# Altium project Pukk-Display-Module-v1.0.PrjPcb (part 1 of 4)
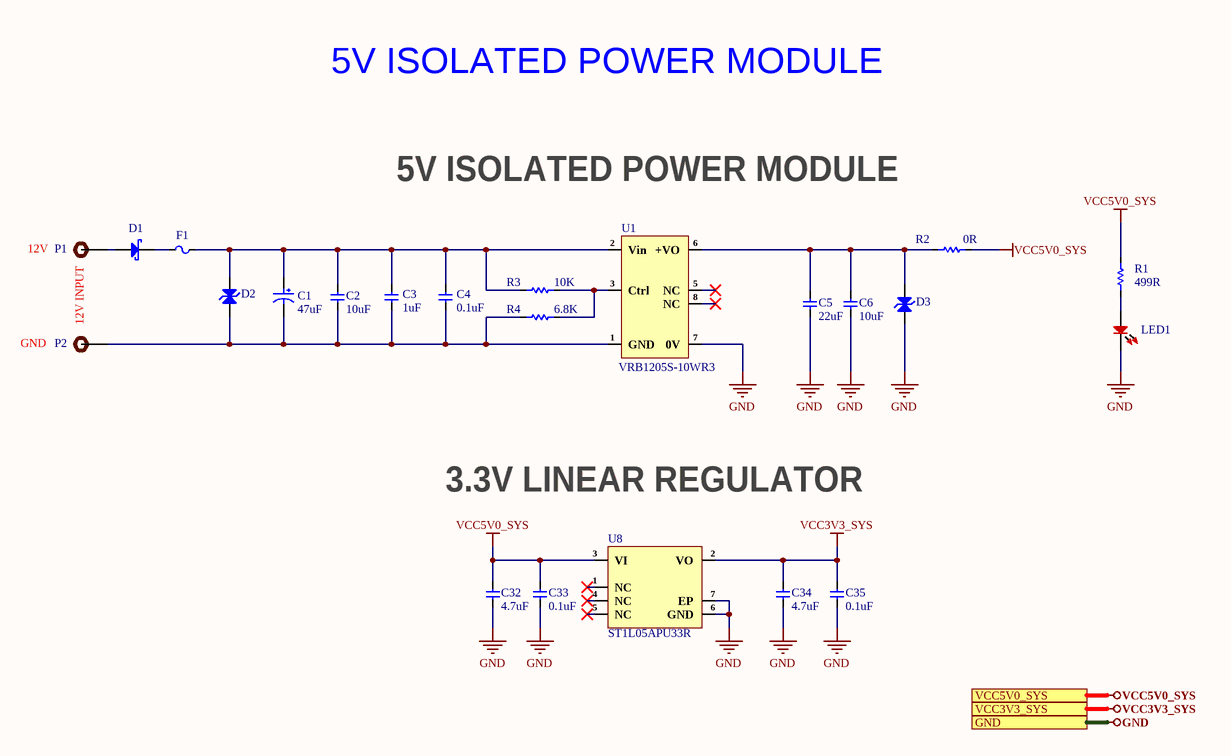
[diagram p0: POWER_SHEET.SchDoc]
10 sheets, 157 parts. Net scope: flat (ports and power ports of the same name join across sheets).
Board file: Pukk-Display-Module-v1.0.PcbDoc
Sheets:
  POWER_SHEET.SchDoc
  radxa_CM3J_SHEET-1.SchDoc
  radxa_CM3J_SHEET-2.SchDoc
  CAN_SHEET.SchDoc
  TYPE-C_INTERFACE_SHEET.SchDoc
  MIPI_DISPLAY-SHEET.SchDoc
  HDMI2.0_SHEET.SchDoc
  GPS_INTERFACE_SHEET.SchDoc
  JOYSTICK_BUTTON_SHEET.SchDoc
  MISCELLANEOUS_SHEET.SchDoc

## Sheet POWER_SHEET.SchDoc
size A4; SheetNumber: 1; SheetTotal: 10

### Parts
C1  47uF  [25SVPF47M]
C2  10uF  [Cap-0603]
C3  1uF  [Cap-0603]
C4  0.1uF  [Cap-0603]
C5  22uF  [Cap-0805]
C6  10uF  [Cap-0603]
C32  4.7uF  [Cap-0402]
C33  0.1uF  [Cap-0402]
C34  4.7uF  [Cap-0402]
C35  0.1uF  [Cap-0402]
D1  SS56  [SMA]  (value not drawn)
D2  SD12C.TCT  [SOD-323 (Bi-directional)]  (value not drawn)
D3  SMAJ5.0CA  [SMA Bi Directional]  (value not drawn)
F1  BSMD1812-150-33V  [Fuse-1812_]  (value not drawn)
LED1  RED  [LED-0603]  (value not drawn)
P1  0.5mm Test Pad  [0.5mm Test Pad]  (value not drawn)  (no BOM)
P2  0.5mm Test Pad  [0.5mm Test Pad]  (value not drawn)  (no BOM)
R1  499R  [Res-0402]
R2  0R  [Res-0805]
R3  10K  [Res-0402]
R4  6.8K  [Res-0402]
U1  VRB1205S-10WR3  [VRB1205S-10WR3]
U8  ST1L05APU33R  [DFN-6(3x3)]

### Ports
GND (see CAN_SHEET[3D], GPS_INTERFACE_SHEET[3D], HDMI2.0_SHEET[3D], JOYSTICK_BUTTON_SHEET[3D], MIPI_DISPLAY-SHEET[3D], MISCELLANEOUS_SHEET[3D], radxa_CM3J_SHEET-1[4C], radxa_CM3J_SHEET-2[3D], TYPE-C_INTERFACE_SHEET[3D]), VCC3V3_SYS (see GPS_INTERFACE_SHEET[3D], HDMI2.0_SHEET[3D], MIPI_DISPLAY-SHEET[3D], MISCELLANEOUS_SHEET[3D]), VCC5V0_SYS (see CAN_SHEET[3D], HDMI2.0_SHEET[3D], MIPI_DISPLAY-SHEET[3D], radxa_CM3J_SHEET-1[4C], TYPE-C_INTERFACE_SHEET[3D])

### Nets
GND: C5.1 C6.1 C32.1 C33.1 C34.1 C35.1 D3.1(A) LED1.2 U1.7(0V) U8.6(GND) U8.7(EP) ; port GND
VCC3V3_SYS: C34.2 C35.2 U8.2(VO) ; port VCC3V3_SYS
VCC5V0_SYS: C32.2 C33.2 R1.1 R2.2 U8.3(VI) ; port VCC5V0_SYS
NetC1_1: C1.1 C2.2 C3.2 C4.2 D2.2(A) F1.2 R3.2 U1.2(Vin)
NetC1_2: C1.2 C2.1 C3.1 C4.1 D2.1(A) P2.1 R4.1 U1.1(GND)
NetC5_2: C5.2 C6.2 D3.2(K) R2.1 U1.6(+VO)
NetD1_1: D1.1(K) F1.1
NetD1_2: D1.2(A) P1.1
NetLED1_1: LED1.1 R1.2
NetR3_1: R3.1 R4.2 U1.3(Ctrl)

Not connected (* = marked no-connect by the designer): U1 5(NC)* 8(NC)*; U8 1(NC)* 4(NC)* 5(NC)*

### Notes on the sheet
- 5V ISOLATED POWER MODULE
- (near P1) 12V
- (near P2) GND
- 12V INPUT
- 3.3V LINEAR REGULATOR
- File:
- Title:
- Date:
- Page
- Num:
- Total:
- Drawn By: Huzaifa Ali

### Library data of the parts
C1 = 25SVPF47M: CAP ALUM POLY 47UF 20% 25V SMD; Manufacturer: Panasonic; Dielectric Material: Aluminium; Polarity: Polarized; ESR (Equivalent Series Resistance): 30mR; Leakage Current: 235uA; Ripple Current: 140mA; Tan Delta: 0.12; Item Type: Capacitor; Supplier 1: Avnet; Manufacturer Part Number: 25SVPF47M; RoHS: Yes; Category: Polymer Capacitors; Stock 1: 1000; Pricing 1: 1000=0.43572, 2000=0.42658, 4000=0.41744, 6000=0.40830, 8000=0.39916 (USD); Mounting Technology: Surface Mount; Pins: 2; Package Shape: Cylindrical; Case/Package: 2626; Min Operating Temperature: -55°C; Max Operating Temperature: 105°C; Value: 47uF; Capacitor Type: Aluminium; Tolerance  (fill in as +-): 20%; Package Style: SMTMeter; Packaging: Tape and Reel; Tolerance (fill in as +-): 20%; Rated DC Voltage (URdc): 25V; Termination: Flat; Length: 7.3mm; Width: 6.6mm; Height: 5.9mm; Reach SVHC Compliant: Yes; RoHS Compliant: Yes; ComponentLink1URL: https://datasheet.ciiva.com:443/pdfs/VipMasterIC/IC/PANA/PANA-S-A0008969958/PANA-S-A0008969958-1.pdf?src-supplier=IHS+Markit; ComponentLink1Description: https://datasheet.ciiva.com:443/pdfs/VipMasterIC/IC/PANA/PANA-S-A0008969958/PANA-S-A0008969958-1.pdf?src-supplier=IHS+Markit; ComponentLink2URL: https://datasheet.ciiva.com/48542/svpf-eng-ds-48542390.pdf?src-supplier=Distrelec; ComponentLink2Description: https://datasheet.ciiva.com/48542/svpf-eng-ds-48542390.pdf?src-supplier=Distrelec; ComponentLink3URL: https://datasheet.ciiva.com/25746/1734360-25746558.pdf?src-supplier=Farnell; ComponentLink3Description: https://datasheet.ciiva.com/25746/1734360-25746558.pdf?src-supplier=Farnell; ComponentLink4URL: https://datasheet.ciiva.com/22746/1734360-22746218.pdf?src-supplier=Element14; ComponentLink4Description: https://datasheet.ciiva.com/22746/1734360-22746218.pdf?src-supplier=Element14; ComponentLink5URL: https://datasheet.ciiva.com/24025/svpf-os-262415-24025725.pdf?src-supplier=Mouser; ComponentLink5Description: https://datasheet.ciiva.com/24025/svpf-os-262415-24025725.pdf?src-supplier=Mouser; Supplier Part Number 1: 25SVPF47M; LCSC Part Number: C136280
C2 C6 = GRM188R61E106MA73D: CAP CER 10UF 25V X5R 0603; Manufacturer: Murata; Item Type: Capacitors; Material: 4241ConductorMaterial; Tolerance: 20%; Supplier: Mouser; LCSC Part Number: C91606; Manufacturer Part Number: GRM188R61E106MA73D; RoHS: Yes; Stock: 623875; Pricing: 1=0.18, 10=0.054, 50=0.054, 100=0.046, 1000=0.044, 10000=0.04 (USD); Mounting Technology: Surface Mount; Case/Package: 0603; Pins: 2; Case Code (Metric): 1608; Case Code (Imperial): 0603; Weight: 0.000222oz; Min Operating Temperature: -55°C; Max Operating Temperature: 85°C; Voltage Rating: 25V; Value: 10uF; Packaging: Cut Tape; Package Quantity: 1; Dielectric: X5R; Voltage: 25V; Termination: SMD/SMT; Voltage Rating (DC): 25V; Series: GRM; Construction: Flat; Length: 1.6mm; Width: 0.031inch; Height: 0.8mm; Thickness: 0.031inch; Depth: 0.8mm; Reach SVHC Compliant: No; RoHS Compliant: Yes; Lead Free: 5697LeadFree; ComponentLink1URL: https://datasheet.ciiva.com/22776/c02e-22776427.pdf?src-supplier=Farnell; ComponentLink1Description: https://datasheet.ciiva.com/22776/c02e-22776427.pdf?src-supplier=Farnell; ComponentLink2URL: https://datasheet.ciiva.com/22619/c02e-22619674.pdf?src-supplier=Element14; ComponentLink2Description: https://datasheet.ciiva.com/22619/c02e-22619674.pdf?src-supplier=Element14; ComponentLink3URL: https://datasheet.ciiva.com/22776/608985-22776426.pdf?src-supplier=Farnell; ComponentLink3Description: https://datasheet.ciiva.com/22776/608985-22776426.pdf?src-supplier=Farnell; ComponentLink4URL: https://datasheet.ciiva.com/14906/partnumbering-e-01-14906431.pdf?src-supplier=Digikey; ComponentLink4Description: https://datasheet.ciiva.com/14906/partnumbering-e-01-14906431.pdf?src-supplier=Digikey; ComponentLink5URL: https://datasheet.ciiva.com/14906/partnumbering-e-01-14906429.pdf?src-supplier=Digikey; ComponentLink5Description: https://datasheet.ciiva.com/14906/partnumbering-e-01-14906429.pdf?src-supplier=Digikey
C3 = C1608X7R1E105K080AB: CAP CER 1UF 25V X7R 0603; Manufacturer: TDK; Tolerance: 10%; Item Type: Capacitors; Material: 4241ConductorMaterial; Manufacturer Part Number: C1608X7R1E105K080AB; RoHS: Yes; Case/Package: 0603; Case Code (Metric): 1608; Case Code (Imperial): 0603; Min Operating Temperature: -55°C; Max Operating Temperature: 125°C; Packaging: Tape and Reel; Voltage Rating: 25V; Dielectric: X7R; Package Quantity: 1; Length: 1.6mm; Width: 0.031inch; Thickness: 0.037inch; Lead Free: Lead Free; RoHS Compliant: Yes; ComponentLink1URL: https://datasheet.ciiva.com/23802/1796654-23802776.pdf?src-supplier=Newark; ComponentLink1Description: https://datasheet.ciiva.com/23802/1796654-23802776.pdf?src-supplier=Newark; ComponentLink2URL: https://datasheet.ciiva.com/22725/1913358-22725530.pdf?src-supplier=Element14; ComponentLink2Description: https://datasheet.ciiva.com/22725/1913358-22725530.pdf?src-supplier=Element14; ComponentLink3URL: https://datasheet.ciiva.com/28693/mlcc-commercial-general-en-28693447.pdf?src-supplier=Element14; ComponentLink3Description: https://datasheet.ciiva.com/28693/mlcc-commercial-general-en-28693447.pdf?src-supplier=Element14; Supplier: Digikey; Stock: 239206; Pricing: 1=0.18, 10=0.103, 50=0.0722, 100=0.0627, 500=0.04664, 1000=0.04163 (USD); Mounting Technology: Surface Mount; Dielectric Material: 4241ConductorMaterial; Value: 1uF; Voltage: 25V; Series: C; Construction: Flat; Height: 0.8mm; Depth: 0.8mm; Radiation Hardening: No; Reach SVHC Compliant: No; ComponentLink4URL: https://datasheet.ciiva.com/6290/tdkmlcccaprange-6290854.pdf?src-supplier=Digikey; ComponentLink4Description: https://datasheet.ciiva.com/6290/tdkmlcccaprange-6290854.pdf?src-supplier=Digikey; ComponentLink5URL: https://datasheet.ciiva.com/26834/getdatasheetpartid-727834-26834380.pdf?src-supplier=Verical; ComponentLink5Description: https://datasheet.ciiva.com/26834/getdatasheetpartid-727834-26834380.pdf?src-supplier=Verical
C4 = CC0603JRX7R8BB104: CAP CER 0.1UF 25V X7R 0603; Manufacturer: Yageo; Tolerance: 5%; Item Type: Capacitors; Value: 100nF; Manufacturer Part Number: CC0603JRX7R8BB104; RoHS: Yes; Case/Package: 0603; Case Code (Imperial): 0603; Case Code (Metric): 1608; Min Operating Temperature: -55°C; Max Operating Temperature: 125°C; Dielectric: X7R; Voltage Rating: 25V; Voltage Rating (DC): 25V; Packaging: Tape and Reel; Termination: SMD/SMT; Length: 1.6mm; Width: 0.031inch; Height: 0.8mm; Thickness: 0.035inch; Lead Free: Lead Free; Halogen Free: Halogen Free; ComponentLink1URL: https://datasheet.ciiva.com/11465/upy-gphc-x7r-6-3v-to-50v-8-11465031.pdf?src-supplier=Avnet; ComponentLink1Description: https://datasheet.ciiva.com/11465/upy-gphc-x7r-6-3v-to-50v-8-11465031.pdf?src-supplier=Avnet; LCSC Part Number: C327087; Supplier: Digikey; Stock: 448767; Pricing: 1=0.1, 10=0.057, 50=0.039, 100=0.0335, 500=0.02436, 1000=0.0215 (USD); Mounting Technology: Surface Mount; Weight: 7.1E-05oz; Series: CC; Construction: Flat; RoHS Compliant: Yes
C5 = GRM21BZ71A226ME15L: CAP CER 22UF 10V X7R 0805; Manufacturer: Murata; Material: 4241ConductorMaterial; Tolerance: 20%; Item Type: Capacitor; Supplier: Digi-Key; Supplier Part Number: 490-GRM21BZ71A226ME15LCT-ND; Manufacturer Part Number: GRM21BZ71A226ME15L; RoHS: Yes; Category: Ceramic Capacitors; Stock: 49126; Pricing: 1=0.39, 10=0.259, 50=0.191, 100=0.1556, 500=0.12282, 1000=0.10372 (USD); Package: 0805; Min Operating Temperature: -55°C; Max Operating Temperature: 125°C; Value: 22uF; Voltage Rating: 10V; Length: 2mm; Width: 1.25mm; Height: 1.45mm; Thickness: 1.25mm; ComponentLink1URL: https://datasheet.octopart.com/GRM21BZ71A226ME15L-Murata-datasheet-165579666.pdf?src-supplier=TME; ComponentLink1Description: https://datasheet.octopart.com/GRM21BZ71A226ME15L-Murata-datasheet-165579666.pdf?src-supplier=TME; LCSC Part Number: C907991; ComponentLink2Description: LCSC; ComponentLink2URL: https://www.lcsc.com/product-detail/Multilayer-Ceramic-Capacitors-MLCC-SMD-SMT_Murata-Electronics-GRM21BZ71A226ME15L_C907991.html
C32 C34 = CL05A475MO5NUNC: CAP CER 4.7UF 16V X5R 0402; Manufacturer: Samsung; Tolerance: 20%; Material: 4241ConductorMaterial; Manufacturer Part Number: CL05A475MO5NUNC; RoHS: Yes; Case/Package: 0402; Case Code (Metric): 1005; Case Code (Imperial): 0402; Min Operating Temperature: -55°C; Max Operating Temperature: 85°C; Voltage Rating: 16V; Packaging: Cut Tape; Voltage Rating (DC): 16V; Series: CL; Length: 0.039inch; Width: 0.02inch; Height: 550um; RoHS Compliant: Yes; ComponentLink1URL: http://www.farnell.com/datasheets/2710653.pdf?src-supplier=Farnell; ComponentLink1Description: http://www.farnell.com/datasheets/2710653.pdf?src-supplier=Farnell; ComponentLink2URL: http://www.samsungsem.com/kr/support/product-search/mlcc/CL05A475MO5NUNC.jsp?src-supplier=Digikey; ComponentLink2Description: http://www.samsungsem.com/kr/support/product-search/mlcc/CL05A475MO5NUNC.jsp?src-supplier=Digikey; ComponentLink3URL: http://www.farnell.com/datasheets/2710653.pdf?src-supplier=Element14; ComponentLink3Description: http://www.farnell.com/datasheets/2710653.pdf?src-supplier=Element14; ComponentLink4URL: https://datasheet.octopart.com/CL05A475MO5NUNC-Samsung-Electro-Mechanics-datasheet-123102911.pdf?src-supplier=Future+Electronics; ComponentLink4Description: https://datasheet.octopart.com/CL05A475MO5NUNC-Samsung-Electro-Mechanics-datasheet-123102911.pdf?src-supplier=Future+Electronics; ComponentLink5URL: http://www.farnell.com/datasheets/2710653.pdf?src-supplier=Newark; ComponentLink5Description: http://www.farnell.com/datasheets/2710653.pdf?src-supplier=Newark; Supplier 1: Avnet; Category: Ceramic Capacitors; Stock 1: 50000; Pricing 1: 10000=0.09712 (USD); Mount: Surface Mount; Capacitance: 4.7uF; Thickness: 0.022inch; Supplier Part Number 1: CL05A475MO5NUNC
C33 C35 = GRM155R71H104ME14D: CAP CER 0.1UF 50V X7R 0402; Manufacturer: Murata; Tolerance: 20%; Capacitance: 100nF; Item Type: Capacitor; Supplier 1: Avnet; Manufacturer Part Number: GRM155R71H104ME14D; RoHS: Yes; Category: Ceramic Capacitors; Stock 1: 100000; Pricing 1: 10000=0.00444, 20000=0.00420, 40000=0.00396, 60000=0.00372, 80000=0.00348, 100000=0.00324, 1000000=0.00300 (USD); Mount: Surface Mount; Case/Package: 0402; Min Operating Temperature: -55°C; Max Operating Temperature: 125°C; Packaging: Cut Tape; Voltage Rating: 50V; Length: 0.039inch; Width: 0.02inch; Thickness: 0.022inch; RoHS Compliant: Yes; ComponentLink1URL: http://www.mouser.com/ds/2/281/c02e-2905.pdf?src-supplier=Mouser; ComponentLink1Description: http://www.mouser.com/ds/2/281/c02e-2905.pdf?src-supplier=Mouser; ComponentLink2URL: http://search.murata.co.jp/Ceramy/image/img/A01X/G101/ENG/GRM155R71H104ME14-01.pdf?src-supplier=Digi-Key; ComponentLink2Description: http://search.murata.co.jp/Ceramy/image/img/A01X/G101/ENG/GRM155R71H104ME14-01.pdf?src-supplier=Digi-Key; ComponentLink3URL: http://psearch.en.murata.com/capacitor/product/GRM155R71H104ME14%23.pdf?src-supplier=Avnet; ComponentLink3Description: http://psearch.en.murata.com/capacitor/product/GRM155R71H104ME14%23.pdf?src-supplier=Avnet; Supplier Part Number 1: GRM155R71H104ME14D; LCSC Part Number: C182412
D1 = SS56: DIODE SCHOTTKY 60V 5A SMA; Manufacturer: MDD; LCSC Par Number: C65009; Manufacturer Part Number: SS56; Iterm Type: Diode; ComponentLink1Description: LCSC; ComponentLink1URL: https://www.lcsc.com/product-detail/Schottky-Barrier-Diodes-SBD_MDD-Microdiode-Electronics-SS56_C65009.html
D2 = SD12C.TCT: 24V 350W 13.3V 12V SOD-323 ESD and Surge Protection (TVS/ESD) ROHS; Manufacturer: SEMTECH; Item Type: Diode; Manufacturer Part Number: SD12C.TCT; Package: SOD-323; LCSC Part Number: C85198; ComponentLink1Description: LCSC; ComponentLink1URL: https://www.lcsc.com/product-detail/ESD-and-Surge-Protection-TVS-ESD_SEMTECH-SD12C-TCT_C85198.html?s_z=n_SD12
D3 = SMAJ5.0CA: TVS DIODE 5VWM 9.2VC SMA; Manufacturer: FTR; Manufacturer Part Number: SMAJ5.0CA; Package: SMA(DO-214AC); Item Type: Diode; LCSC Part Number: C693487; ComponentLink1Description: LCSC; ComponentLink1URL: https://www.lcsc.com/product-detail/TVS_GOODWORK-SMAJ5-0CA_C908809.html
F1 = BSMD1812-150-33V: 33V 1.5A 40A 3A 1812 Resettable Fuses ROHS; Manufacturer: BHFUSE; Item Type: Fuse; Manufacturer Part Number: BSMD1812-150-33V; Package: 1812; LCSC Part Number: C883154; ComponentLink1Description: LCSC; ComponentLink1URL: https://www.lcsc.com/product-detail/Resettable-Fuses_BHFUSE-BSMD1812-150-33V_C883154.html
LED1 = NCD0603R3: RED LED 0603 Light Emitting Diodes; Manufacturer: Foshan NationStar Optoelectronics; Manufacturer Part Number: NCD0603R3; Package: 0603; Item Type: LED; LCSC Part Number: C3151730; ComponentLink1Description: LCSC; ComponentLink1URL: https://www.lcsc.com/product-detail/Light-Emitting-Diodes-LED_Foshan-NationStar-Optoelectronics-NCD0603R3_C3151730.html
P1 P2 = 0.5mm Test Pad: Test pad
R1 = RC0402FR-07499RL: RES 499 OHM 1% 1/16W 0402; Manufacturer: Yageo; Power Rating: 62.5mW; Voltage Rating: 50V; Max Power Dissipation: 63mW; Temperature Coefficient: 100ppm/°C; Supplier 1: Mouser; Manufacturer Part Number: RC0402FR-07499RL; RoHS: Yes; Category: Chip SMD Resistors; Stock 1: 936879; Pricing 1: 1=0.10000, 10=0.01200, 50=0.01200, 100=0.00500, 1000=0.00300, 10000=0.00100 (USD); Case/Package: 0402; Case Code (Metric): 1005; Case Code (Imperial): 0402; Size Code: 0402; Min Operating Temperature: -55°C; Max Operating Temperature: 155°C; Resistance: 499R; Tolerance: 1%; Package Quantity: 1; Packaging: Tape and Reel; Resistor Type: Thick Film; Number of Terminations: 2; Termination: SMD/SMT; Voltage Rating (DC): 50V; Features: Moisture Resistant; Series: RC; Resistance Tolerance: 1%; Construction: Rectangular; Length: 1mm; Width: 0.02inch; Height: 0.016inch; Depth: 0.5mm; RoHS Compliant: Yes; REACH SVHC: No SVHC; Military Standard: Not; Lead Free: Lead Free; ComponentLink1URL: https://datasheet.ciiva.com/2453/pyu-r-int-thick-7-2453539.pdf?src-supplier=Digi-Key; ComponentLink1Description: https://datasheet.ciiva.com/2453/pyu-r-int-thick-7-2453539.pdf?src-supplier=Digi-Key; ComponentLink2URL: https://datasheet.ciiva.com/2453/pyu-r-int-thick-7-2453540.pdf?src-supplier=Digi-Key; ComponentLink2Description: https://datasheet.ciiva.com/2453/pyu-r-int-thick-7-2453540.pdf?src-supplier=Digi-Key; ComponentLink3URL: https://datasheet.ciiva.com/2453/pyu-r-int-thick-7-2453538.pdf?src-supplier=Digi-Key; ComponentLink3Description: https://datasheet.ciiva.com/2453/pyu-r-int-thick-7-2453538.pdf?src-supplier=Digi-Key; Supplier Part Number 1: 603-RC0402FR-07499RL; LCSC Part Number: C137970
R2 = RC0805FR-070RL: RES 0 OHM JUMPER 1/8W 0805; Manufacturer: Yageo; Resistance: 0mR; Tolerance: 1%; Power Rating: 125mW; Item Type: Resistor; Supplier 1: Avnet; Manufacturer Part Number: RC0805FR-070RL; RoHS: Yes; Category: Chip SMD Resistors; Stock 1: 85000; Pricing 1: 5000=0.00281, 10000=0.00277, 20000=0.00269 (USD); Case/Package: 0805; Contact Plating: Tin,Matte; Case Code (Imperial): 0805; Case Code (Metric): 2012; Size Code: 0805; Min Operating Temperature: -55°C; Max Operating Temperature: 155°C; Resistor Type: Thick Film; Packaging: Tape and Reel; Features: Moisture Resistant; Series: RC; Max Power Dissipation: 125mW; Number of Terminations: 2; Construction: Rectangular; Length: 2mm; Depth: 1.25mm; Radiation Hardening: No; Military Standard: Not; Lead Free: Lead Free; RoHS Compliant: Yes; ComponentLink1URL: https://datasheet.ciiva.com/15189/getdatasheetpartid-348154-15189885.pdf?src-supplier=Verical; ComponentLink1Description: https://datasheet.ciiva.com/15189/getdatasheetpartid-348154-15189885.pdf?src-supplier=Verical; ComponentLink2URL: https://datasheet.ciiva.com/17042/rc0805-17042698.pdf?src-supplier=Future+Electronics; ComponentLink2Description: https://datasheet.ciiva.com/17042/rc0805-17042698.pdf?src-supplier=Future+Electronics; Supplier Part Number 1: RC0805FR-070RL; LCSC Part Number: C100045
R3 = RC0402FR-0710KL: RES 10K OHM 1% 1/16W 0402; Manufacturer: Yageo; Resistance: 10kR; Voltage Rating (DC): 50V; Temperature Coefficient: 100ppm/°C; Power Rating: 62.5mW; Max Power Dissipation: 63mW; Item Type: Resistor; Supplier 1: Mouser; Manufacturer Part Number: RC0402FR-0710KL; RoHS: Yes; Category: Chip SMD Resistors; Stock 1: 18648329; Pricing 1: 1=0.10000, 10=0.01400, 50=0.01400, 100=0.00500, 1000=0.00300, 10000=0.00200 (USD); Case/Package: 0402; Number of Pins: 2; Case Code (Imperial): 0402; Case Code (Metric): 1005; Min Operating Temperature: -55°C; Max Operating Temperature: 155°C; Resistor Type: Thick Film; Tolerance: 1%; Packaging: Tape and Reel; Voltage Rating: 50V; Termination: SMD/SMT; Working Voltage: 50V; Number of Terminations: 2; Features: Moisture Resistant; Series: RC; Resistance Tolerance: 1%; Construction: Rectangular; Length: 1mm; Width: 0.5mm; Height: 0.32mm; Depth: 0.5mm; Lead Pitch: 0.2mm; REACH SVHC: No SVHC; Lead Free: Lead Free; RoHS Compliant: Yes; Military Standard: Not; ComponentLink1URL: https://datasheet.ciiva.com/7660/38568-7660787.pdf?src-supplier=Element14; ComponentLink1Description: https://datasheet.ciiva.com/7660/38568-7660787.pdf?src-supplier=Element14; ComponentLink2URL: https://datasheet.ciiva.com/7849/1686128-7849814.pdf?src-supplier=Element14; ComponentLink2Description: https://datasheet.ciiva.com/7849/1686128-7849814.pdf?src-supplier=Element14; ComponentLink3URL: https://datasheet.ciiva.com/7983/1018594-7983486.pdf?src-supplier=Element14; ComponentLink3Description: https://datasheet.ciiva.com/7983/1018594-7983486.pdf?src-supplier=Element14; ComponentLink4URL: https://datasheet.ciiva.com/22747/1018594-22747512.pdf?src-supplier=Element14; ComponentLink4Description: https://datasheet.ciiva.com/22747/1018594-22747512.pdf?src-supplier=Element14; ComponentLink5URL: https://datasheet.ciiva.com/12667/pyu-rc0402-51-rohs-l-6-r-12667067.pdf?src-supplier=Mouser; ComponentLink5Description: https://datasheet.ciiva.com/12667/pyu-rc0402-51-rohs-l-6-r-12667067.pdf?src-supplier=Mouser; ComponentLink6URL: https://datasheet.ciiva.com/7849/1784430-7849813.pdf?src-supplier=Element14; ComponentLink6Description: https://datasheet.ciiva.com/7849/1784430-7849813.pdf?src-supplier=Element14; ComponentLink7URL: https://datasheet.ciiva.com/7849/1784430-7849815.pdf?src-supplier=Element14; ComponentLink7Description: https://datasheet.ciiva.com/7849/1784430-7849815.pdf?src-supplier=Element14; Supplier Part Number 1: 603-RC0402FR-0710KL; LCSC Part Number: C60490
R4 = RT0402BRC076K8L: RES SMD 6.8K OHM 0.1% 1/16W 0402; Manufacturer: Yageo; Item Type: Resistors; Value: 6.8kR; Max Power Dissipation: 63mW; Temperature Coefficient: 15ppm/°C; Supplier: Digikey; LCSC Part Number: C852943; Manufacturer Part Number: RT0402BRC076K8L; RoHS: Yes; Stock: 20494; Pricing: 1=0.51, 10=0.36, 50=0.279, 100=0.2487, 500=0.18748, 1000=0.16452, 5000=0.14066 (USD); Case/Package: 0402; Min Operating Temperature: -55°C; Max Operating Temperature: 155°C; Packaging: Tape and Reel; Number of Terminations: 2; Tolerance: 0.1%; Features: Moisture Resistant; Series: RT; Length: 0.039inch; Width: 0.02inch; Height: 0.014inch; RoHS Compliant: Yes
U1 = VRB1205S-10WR3: SIP Isolated Power Modules ROHS; Manufacturer: YLPTEC; Manufacturer Part Number: VRB1205S-10WR3; Package: SIP; LCSC Part Number: C5369851; Item Type: Power Module; ComponentLink1Description: LCSC; ComponentLink1URL: https://jlcpcb.com/partdetail/Ylptec-VRB1205S10WR3/C5369851
U8 = ST1L05APU33R: IC REG LINEAR 3.3V 1.3A 6DFN; Manufacturer: STMicroelectronics; Supplier: Digikey; LCSC Part Number: C283488; Manufacturer Part Number: ST1L05APU33R; RoHS: Yes; Item Type: IC; Stock: 7599; Pricing: 1=1.06, 10=0.766, 25=0.692, 100=0.6103, 250=0.57136, 500=0.5479, 1000=0.5286 (USD); ComponentLink1URL: https://datasheet.ciiva.com/2053/cd00186925-2053848.pdf?src-supplier=Digikey; ComponentLink1Description: https://datasheet.ciiva.com/2053/cd00186925-2053848.pdf?src-supplier=Digikey; ComponentLink2URL: https://datasheet.ciiva.com/2053/cd00186925-2053849.pdf?src-supplier=Digikey; ComponentLink2Description: https://datasheet.ciiva.com/2053/cd00186925-2053849.pdf?src-supplier=Digikey; ComponentLink3URL: https://datasheet.ciiva.com/2053/cd00186925-2053850.pdf?src-supplier=Digikey; ComponentLink3Description: https://datasheet.ciiva.com/2053/cd00186925-2053850.pdf?src-supplier=Digikey; ComponentLink4URL: https://datasheet.ciiva.com/16489/cd00186925-16489850.pdf?src-supplier=Future+Electronics; ComponentLink4Description: https://datasheet.ciiva.com/16489/cd00186925-16489850.pdf?src-supplier=Future+Electronics

## Sheet radxa_CM3J_SHEET-1.SchDoc
size A4; SheetNumber: 2; SheetTotal: 10
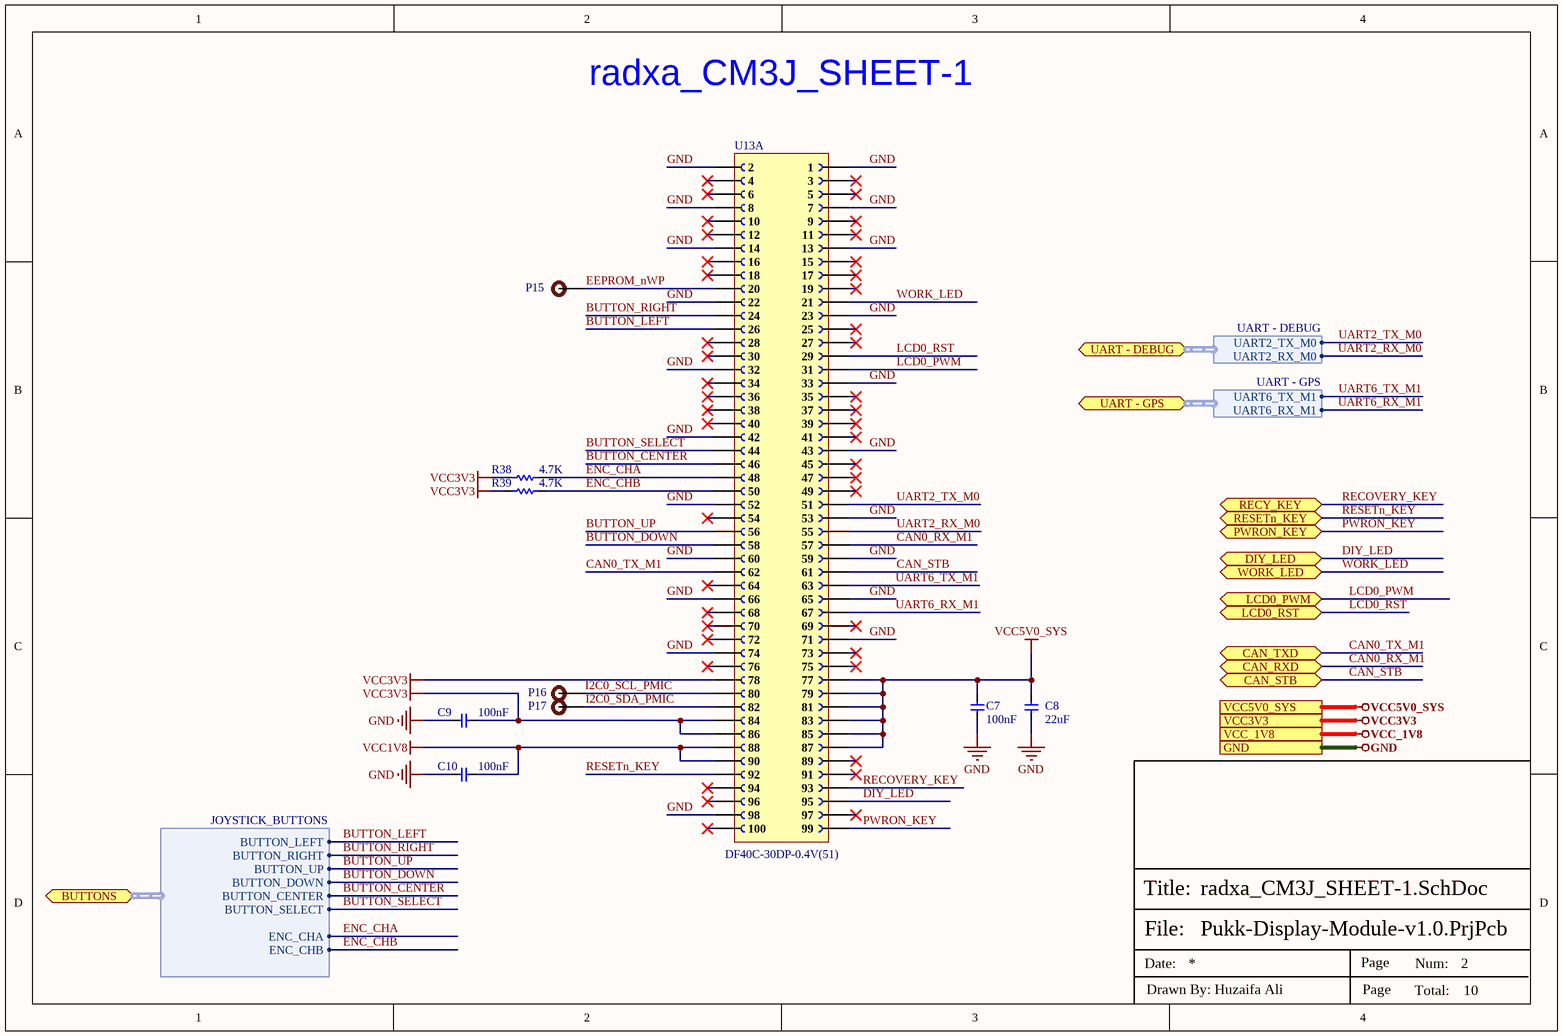
[diagram p1: radxa_CM3J_SHEET-1.SchDoc]

### Parts
C7  100nF  [Cap-0402]
C8  22uF  [Cap-0402]
C9  100nF  [Cap-0402]
C10  100nF  [Cap-0402]
P15  TEST POINT 0.5mm Dia  [Test-point - 0.5mm]  (value not drawn)  (no BOM)
P16  TEST POINT 0.5mm Dia  [Test-point - 0.5mm]  (value not drawn)  (no BOM)
P17  TEST POINT 0.5mm Dia  [Test-point - 0.5mm]  (value not drawn)  (no BOM)
R38  4.7K  [Res-0402]
R39  4.7K  [Res-0402]
U13A  DF40C-30DP-0.4V(51)  [DF40C-100DS-0.4V(51)]

### Ports
BUTTONS (bidir, harness JOYSTICK_BUTTONS, see JOYSTICK_BUTTON_SHEET[2D]), CAN_RXD (bidir, see CAN_SHEET[2D]), CAN_STB (bidir, see CAN_SHEET[2D]), CAN_TXD (bidir, see CAN_SHEET[2D]), DIY_LED (bidir, see MISCELLANEOUS_SHEET[3D]), GND (see CAN_SHEET[3D], GPS_INTERFACE_SHEET[3D], HDMI2.0_SHEET[3D], JOYSTICK_BUTTON_SHEET[3C], MIPI_DISPLAY-SHEET[3D], MISCELLANEOUS_SHEET[3D], POWER_SHEET[3C], radxa_CM3J_SHEET-2[3D], TYPE-C_INTERFACE_SHEET[3D]), LCD0_PWM (bidir, see MIPI_DISPLAY-SHEET[3D]), LCD0_RST (bidir, see MIPI_DISPLAY-SHEET[3D]), PWRON_KEY (bidir, see MISCELLANEOUS_SHEET[3D]), RECY_KEY (bidir, see MISCELLANEOUS_SHEET[3D]), RESETn_KEY (bidir, see MISCELLANEOUS_SHEET[3D]), UART - DEBUG (bidir, harness UART - DEBUG, see MISCELLANEOUS_SHEET[3C]), UART - GPS (bidir, harness UART - GPS, see GPS_INTERFACE_SHEET[1D]), VCC3V3 (see CAN_SHEET[3D], JOYSTICK_BUTTON_SHEET[3C]), VCC5V0_SYS (see CAN_SHEET[3D], HDMI2.0_SHEET[3D], MIPI_DISPLAY-SHEET[3D], POWER_SHEET[3C], TYPE-C_INTERFACE_SHEET[3D]), VCC_1V8, WORK_LED (bidir, see MISCELLANEOUS_SHEET[3D])

### Harnesses
UART - GPS: UART6_TX_M1, UART6_RX_M1
UART - DEBUG: UART2_TX_M0, UART2_RX_M0
JOYSTICK_BUTTONS: BUTTON_LEFT, BUTTON_RIGHT, BUTTON_UP, BUTTON_DOWN, BUTTON_CENTER, BUTTON_SELECT, ENC_CHA, ENC_CHB

### Nets
GND: C7.1 C8.1 C9.1 C10.1 U13A.1 U13A.2 U13A.7 U13A.8 U13A.13 U13A.14 U13A.22 U13A.23 U13A.32 U13A.33 U13A.42 U13A.43 U13A.52 U13A.53 U13A.59 U13A.60 U13A.65 U13A.66 U13A.71 U13A.74 U13A.98 ; port GND
VCC1V8: C10.2 U13A.88 U13A.90
VCC3V3: C9.2 R38.2 R39.2 U13A.78 U13A.84 U13A.86 ; port VCC3V3
VCC5V0_SYS: C7.2 C8.2 U13A.77 U13A.79 U13A.81 U13A.83 U13A.85 U13A.87 ; port VCC5V0_SYS
VCC_1V8: port VCC_1V8
BUTTON_CENTER: U13A.46 ; port BUTTONS.BUTTON_CENTER
BUTTON_DOWN: U13A.58 ; port BUTTONS.BUTTON_DOWN
BUTTON_LEFT: U13A.26 ; port BUTTONS.BUTTON_LEFT
BUTTON_RIGHT: U13A.24 ; port BUTTONS.BUTTON_RIGHT
BUTTON_SELECT: U13A.44 ; port BUTTONS.BUTTON_SELECT
BUTTON_UP: U13A.56 ; port BUTTONS.BUTTON_UP
CAN0_RX_M1: U13A.57 ; port CAN_RXD
CAN0_TX_M1: U13A.62 ; port CAN_TXD
CAN_STB: U13A.61 ; port CAN_STB
DIY_LED: U13A.95 ; port DIY_LED
EEPROM_nWP: P15.1 U13A.20
ENC_CHA: R38.1 U13A.48 ; port BUTTONS.ENC_CHA
ENC_CHB: R39.1 U13A.50 ; port BUTTONS.ENC_CHB
I2C0_SCL_PMIC: P16.1 U13A.80
I2C0_SDA_PMIC: P17.1 U13A.82
LCD0_PWM: U13A.31 ; port LCD0_PWM
LCD0_RST: U13A.29 ; port LCD0_RST
PWRON_KEY: U13A.99 ; port PWRON_KEY
RECOVERY_KEY: U13A.93 ; port RECY_KEY
RESETn_KEY: U13A.92 ; port RESETn_KEY
UART2_RX_M0: U13A.55 ; port UART - DEBUG.UART2_RX_M0
UART2_TX_M0: U13A.51 ; port UART - DEBUG.UART2_TX_M0
UART6_RX_M1: U13A.67 ; port UART - GPS.UART6_RX_M1
UART6_TX_M1: U13A.63 ; port UART - GPS.UART6_TX_M1
WORK_LED: U13A.21 ; port WORK_LED

Not connected (* = marked no-connect by the designer): U13A 3* 4* 5* 6* 9* 10* 11* 12* 15* 16* 17* 18* 19* 25* 27* 28* 30* 34* 35* 36* 37* 38* 39* 40* 41* 45* 47* 49* 54* 64* 68* 69* 70* 72* 73* 75* 76* 89* 91* 94* 96* 97* 100*

### Notes on the sheet
- radxa_CM3J_SHEET-1
- File:
- Title:
- Date:
- Page
- Num:
- Total:
- Drawn By: Huzaifa Ali

### Library data of the parts
C7 C9 C10 = CC0402KRX5R7BB104: CAP CER 0.1UF 16V X5R 0402; Manufacturer: Yageo; Tolerance: 10%; Supplier 1: Mouser; Manufacturer Part Number: CC0402KRX5R7BB104; RoHS: Yes; Category: Ceramic Capacitors; Stock 1: 936792; Pricing 1: 1=0.10000, 10=0.02300, 50=0.02300, 100=0.01100, 1000=0.00600, 10000=0.00400 (USD); Mount: Surface Mount; Case/Package: 0402; Number of Pins: 2; Case Code (Metric): 1005; Case Code (Imperial): 0402; Min Operating Temperature: -55°C; Max Operating Temperature: 85°C; Capacitance: 100nF; Dielectric: X5R; Packaging: Tape and Reel; Voltage Rating: 16V; Package Quantity: 1; Voltage Rating (DC): 16V; Termination: SMD/SMT; Resistor Type: Ceramic; Series: CC; Construction: Flat; Length: 1mm; Width: 0.02inch; Height: 0.5mm; Thickness: 0.022inch; Depth: 0.5mm; Radiation Hardening: No; REACH SVHC: Unknown; Lead Free: Lead Free; Halogen Free: Halogen Free; RoHS Compliant: Yes; ComponentLink1URL: https://datasheet.ciiva.com/155/mlccorderingcode-155879.pdf?src-supplier=Digi-Key; ComponentLink1Description: https://datasheet.ciiva.com/155/mlccorderingcode-155879.pdf?src-supplier=Digi-Key; ComponentLink2URL: https://datasheet.ciiva.com/155/mlccorderingcode-155878.pdf?src-supplier=Digi-Key; ComponentLink2Description: https://datasheet.ciiva.com/155/mlccorderingcode-155878.pdf?src-supplier=Digi-Key; ComponentLink3URL: https://datasheet.ciiva.com/155/mlccorderingcode-155880.pdf?src-supplier=Digi-Key; ComponentLink3Description: https://datasheet.ciiva.com/155/mlccorderingcode-155880.pdf?src-supplier=Digi-Key; ComponentLink4URL: https://datasheet.ciiva.com/11464/upy-gphc-x5r-4v-to-50v-12-11464869.pdf?src-supplier=Avnet; ComponentLink4Description: https://datasheet.ciiva.com/11464/upy-gphc-x5r-4v-to-50v-12-11464869.pdf?src-supplier=Avnet; Supplier Part Number 1: 603-CC402KRX5R7BB104; LCSC Part Number: C106204
C8 = GRM158R61A226ME15D: CAP CER 22UF 10V X5R 0402; Manufacturer: Murata; Item Type: Capacitor; Material: 4241ConductorMaterial; Dielectric: 1537DielectricType; Tolerance: 20%; Manufacturer Part Number: GRM158R61A226ME15D; LCSC Part Number: C3845593; Supplier: Mouser; Supplier Part Number: 81-GRM158R61A226ME5D; RoHS: Yes; Stock: 328944; Pricing: 1=0.46, 10=0.225, 50=0.225, 100=0.146, 1000=0.124, 10000=0.106 (USD); Case/Package: 343Case; Min Operating Temperature: -55°C; Max Operating Temperature: 85°C; Value: 22uF; Voltage Rating: 10V; Voltage Rating (DC): 10V; Length: 1mm; Width: 500um; Height: 800um; Thickness: 800um; Category: Ceramic Capacitors
P15-P17 = TEST POINT 0.5mm Dia: Test Point ON; Item Type: Test Point; Manufacturer Part Number: TEST POINT 0.5mm Dia
R38 R39 = RC0402FR-074K7L: RES 4.7K OHM 1% 1/16W 0402; Manufacturer: Yageo; Voltage Rating (DC): 50V; Power Rating: 62.5mW; Resistance: 4.7kR; Temperature Coefficient: 100ppm/°C; Max Power Dissipation: 63mW; Item Type: Resistor; Supplier 1: Avnet; Manufacturer Part Number: RC0402FR-074K7L; RoHS: Yes; Category: Chip SMD Resistors; Stock 1: 2420000; Pricing 1: 10000=0.00085 (USD); Case/Package: 0402; Number of Pins: 2; Case Code (Imperial): 0402; Case Code (Metric): 1005; Size Code: 0402; Min Operating Temperature: -55°C; Max Operating Temperature: 155°C; Tolerance: 1%; Voltage Rating: 50V; Packaging: Tape and Reel; Resistor Type: Thick Film; Termination: SMD/SMT; Features: Moisture Resistant; Series: RC; Number of Terminations: 2; Resistance Tolerance: 1%; Construction: Rectangular; Length: 1mm; Width: 0.5mm; Height: 0.32mm; Depth: 0.5mm; Height - Seated (Max): 0.016inch; RoHS Compliant: Yes; Reach SVHC Compliant: Yes; Military Standard: Not; Lead Free: Lead Free; ComponentLink1URL: https://datasheet.ciiva.com/22661/1686128-22661342.pdf?src-supplier=Element14; ComponentLink1Description: https://datasheet.ciiva.com/22661/1686128-22661342.pdf?src-supplier=Element14; ComponentLink2URL: https://datasheet.ciiva.com/7850/1018594-7850022.pdf?src-supplier=Element14; ComponentLink2Description: https://datasheet.ciiva.com/7850/1018594-7850022.pdf?src-supplier=Element14; ComponentLink3URL: https://datasheet.ciiva.com/7850/1018594-7850023.pdf?src-supplier=Element14; ComponentLink3Description: https://datasheet.ciiva.com/7850/1018594-7850023.pdf?src-supplier=Element14; ComponentLink4URL: https://datasheet.ciiva.com/15215/getdatasheetpartid-328119-15215035.pdf?src-supplier=Verical; ComponentLink4Description: https://datasheet.ciiva.com/15215/getdatasheetpartid-328119-15215035.pdf?src-supplier=Verical; Supplier Part Number 1: RC0402FR-074K7L; LCSC Part Number: C105871
U13A = DF40C-30DP-0.4V(51): CONN RCPT 100POS SMD GOLD; Manufacturer: Hirose; Item Type: Headers and Wire Housings; Current Rating: 300mA; Voltage Rating: 30V; Connector Type: Plug; Number of Positions: 30; Contact Resistance: 90mR; Pitch: 0.4mm; Mated Stacking Heights: 4mm; Contact Pitch: 400um; Supplier: Future Electronics; LCSC Part Number: C597931; Manufacturer Part Number: DF40C-30DP-0.4V(51); RoHS: Yes; Stock: 10000; Pricing: 5000=0.405 (USD); Mounting Technology: Surface Mount; Contact Plating: Gold; Contact Material: Bronze,Copper Alloy; Housing Material: Polymer; Housing Color: Black; Package Quantity: 5000; Number of Rows: 2; Packaging: Tape and Reel; Termination: SMD/SMT; Number of Contacts: 30; Orientation: Straight; Series: DF40; Contact Voltage Rating (AC): 30V; Contact Voltage Rating (DC): 30V; Reach SVHC Compliant: No; Lead Free: Lead Free; RoHS Compliant: Yes; ComponentLink1URL: https://datasheet.ciiva.com/11746/0900766b80e0bfd2-11746269.pdf?src-supplier=Rs; ComponentLink1Description: https://datasheet.ciiva.com/11746/0900766b80e0bfd2-11746269.pdf?src-supplier=Rs; ComponentLink2URL: https://datasheet.ciiva.com/46408/1824826-46408902.pdf?src-supplier=Element14; ComponentLink2Description: https://datasheet.ciiva.com/46408/1824826-46408902.pdf?src-supplier=Element14

## Sheet radxa_CM3J_SHEET-2.SchDoc
size A4; SheetNumber: 3; SheetTotal: 10
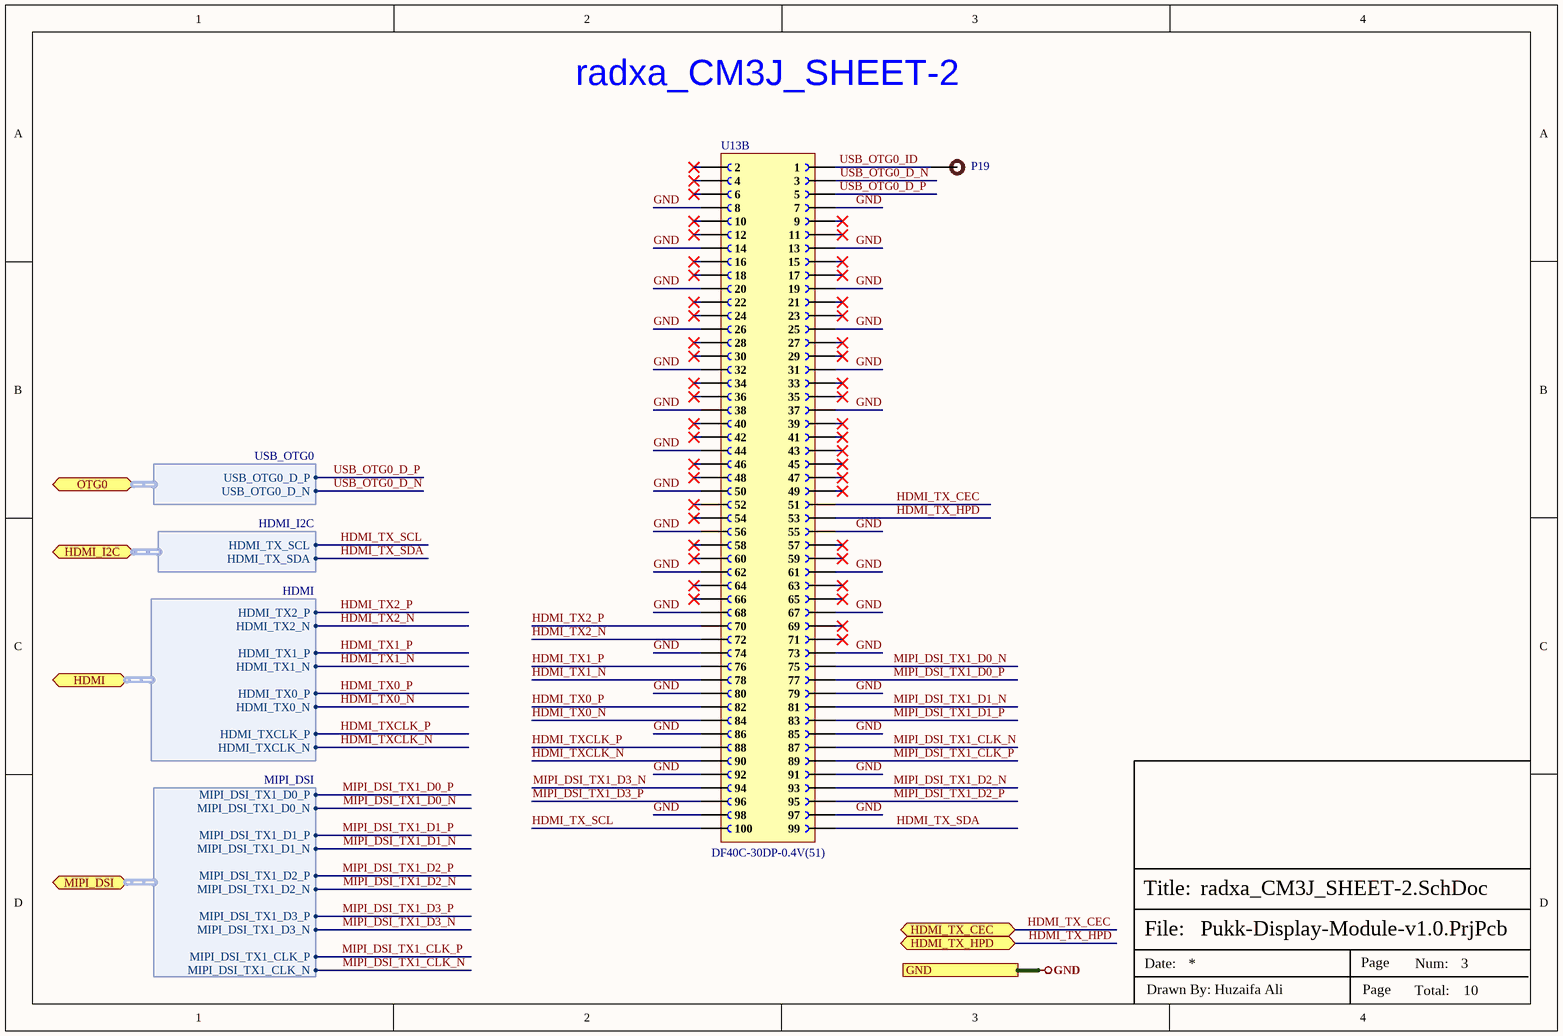
[diagram p2: radxa_CM3J_SHEET-2.SchDoc]

### Parts
P19  TEST POINT 0.5mm Dia  [Test-point - 0.5mm]  (value not drawn)  (no BOM)
U13B  DF40C-30DP-0.4V(51)  [DF40C-100DS-0.4V(51)]

### Ports
GND (see CAN_SHEET[3D], GPS_INTERFACE_SHEET[3D], HDMI2.0_SHEET[3D], JOYSTICK_BUTTON_SHEET[3D], MIPI_DISPLAY-SHEET[3D], MISCELLANEOUS_SHEET[3D], POWER_SHEET[3C], radxa_CM3J_SHEET-1[4C], TYPE-C_INTERFACE_SHEET[3D]), HDMI (bidir, harness HDMI, see HDMI2.0_SHEET[2D]), HDMI_I2C (bidir, harness HDMI_I2C, see HDMI2.0_SHEET[2D]), HDMI_TX_CEC (bidir, see HDMI2.0_SHEET[3D]), HDMI_TX_HPD (bidir, see HDMI2.0_SHEET[3D]), MIPI_DSI (bidir, harness MIPI_DSI, see MIPI_DISPLAY-SHEET[1D]), OTG0 (bidir, harness USB_OTG0, see TYPE-C_INTERFACE_SHEET[2D])

### Harnesses
MIPI_DSI: MIPI_DSI_TX1_D0_P, MIPI_DSI_TX1_D0_N, MIPI_DSI_TX1_D1_P, MIPI_DSI_TX1_D1_N, MIPI_DSI_TX1_D2_P, MIPI_DSI_TX1_D2_N, MIPI_DSI_TX1_D3_P, MIPI_DSI_TX1_D3_N, MIPI_DSI_TX1_CLK_P, MIPI_DSI_TX1_CLK_N
HDMI_I2C: HDMI_TX_SCL, HDMI_TX_SDA
HDMI: HDMI_TX2_P, HDMI_TX2_N, HDMI_TX1_P, HDMI_TX1_N, HDMI_TX0_P, HDMI_TX0_N, HDMI_TXCLK_P, HDMI_TXCLK_N
USB_OTG0: USB_OTG0_D_P, USB_OTG0_D_N

### Nets
GND: U13B.7 U13B.8 U13B.13 U13B.14 U13B.19 U13B.20 U13B.25 U13B.26 U13B.31 U13B.32 U13B.37 U13B.38 U13B.44 U13B.50 U13B.55 U13B.56 U13B.61 U13B.62 U13B.67 U13B.68 U13B.73 U13B.74 U13B.79 U13B.80 U13B.85 U13B.86 U13B.91 U13B.92 U13B.97 U13B.98 ; port GND
HDMI_TX0_N: U13B.84 ; port HDMI.HDMI_TX0_N
HDMI_TX0_P: U13B.82 ; port HDMI.HDMI_TX0_P
HDMI_TX1_N: U13B.78 ; port HDMI.HDMI_TX1_N
HDMI_TX1_P: U13B.76 ; port HDMI.HDMI_TX1_P
HDMI_TX2_N: U13B.72 ; port HDMI.HDMI_TX2_N
HDMI_TX2_P: U13B.70 ; port HDMI.HDMI_TX2_P
HDMI_TX_CEC: U13B.51 ; port HDMI_TX_CEC
HDMI_TX_HPD: U13B.53 ; port HDMI_TX_HPD
HDMI_TX_SCL: U13B.100 ; port HDMI_I2C.HDMI_TX_SCL
HDMI_TX_SDA: U13B.99 ; port HDMI_I2C.HDMI_TX_SDA
HDMI_TXCLK_N: U13B.90 ; port HDMI.HDMI_TXCLK_N
HDMI_TXCLK_P: U13B.88 ; port HDMI.HDMI_TXCLK_P
MIPI_DSI_TX1_CLK_N: U13B.87 ; port MIPI_DSI.MIPI_DSI_TX1_CLK_N
MIPI_DSI_TX1_CLK_P: U13B.89 ; port MIPI_DSI.MIPI_DSI_TX1_CLK_P
MIPI_DSI_TX1_D0_N: U13B.75 ; port MIPI_DSI.MIPI_DSI_TX1_D0_N
MIPI_DSI_TX1_D0_P: U13B.77 ; port MIPI_DSI.MIPI_DSI_TX1_D0_P
MIPI_DSI_TX1_D1_N: U13B.81 ; port MIPI_DSI.MIPI_DSI_TX1_D1_N
MIPI_DSI_TX1_D1_P: U13B.83 ; port MIPI_DSI.MIPI_DSI_TX1_D1_P
MIPI_DSI_TX1_D2_N: U13B.93 ; port MIPI_DSI.MIPI_DSI_TX1_D2_N
MIPI_DSI_TX1_D2_P: U13B.95 ; port MIPI_DSI.MIPI_DSI_TX1_D2_P
MIPI_DSI_TX1_D3_N: U13B.94 ; port MIPI_DSI.MIPI_DSI_TX1_D3_N
MIPI_DSI_TX1_D3_P: U13B.96 ; port MIPI_DSI.MIPI_DSI_TX1_D3_P
USB_OTG0_D_N: U13B.3 ; port OTG0.USB_OTG0_D_N
USB_OTG0_D_P: U13B.5 ; port OTG0.USB_OTG0_D_P
USB_OTG0_ID: P19.1 U13B.1

Not connected (* = marked no-connect by the designer): U13B 2* 4* 6* 9* 10* 11* 12* 15* 16* 17* 18* 21* 22* 23* 24* 27* 28* 29* 30* 33* 34* 35* 36* 39* 40* 41* 42* 43* 45* 46* 47* 48* 49* 52* 54* 57* 58* 59* 60* 63* 64* 65* 66* 69* 71*

### Notes on the sheet
- radxa_CM3J_SHEET-2
- File:
- Title:
- Date:
- Page
- Num:
- Total:
- Drawn By: Huzaifa Ali

### Library data of the parts
P19 = TEST POINT 0.5mm Dia: Test Point ON; Item Type: Test Point; Manufacturer Part Number: TEST POINT 0.5mm Dia
U13B = DF40C-30DP-0.4V(51): as U13A on sheet radxa_CM3J_SHEET-1; Supplier: Future Electronics; LCSC Part Number: C597931; Manufacturer Part Number: DF40C-30DP-0.4V(51); RoHS: Yes; Stock: 10000; Pricing: 5000=0.405 (USD); Mounting Technology: Surface Mount; Contact Plating: Gold; Contact Material: Bronze,Copper Alloy; Housing Material: Polymer; Housing Color: Black; Package Quantity: 5000; Number of Rows: 2; Packaging: Tape and Reel; Termination: SMD/SMT; Number of Contacts: 30; Orientation: Straight; Series: DF40; Contact Voltage Rating (AC): 30V; Contact Voltage Rating (DC): 30V; Reach SVHC Compliant: No; Lead Free: Lead Free; RoHS Compliant: Yes; ComponentLink1URL: https://datasheet.ciiva.com/11746/0900766b80e0bfd2-11746269.pdf?src-supplier=Rs; ComponentLink1Description: https://datasheet.ciiva.com/11746/0900766b80e0bfd2-11746269.pdf?src-supplier=Rs; ComponentLink2URL: https://datasheet.ciiva.com/46408/1824826-46408902.pdf?src-supplier=Element14; ComponentLink2Description: https://datasheet.ciiva.com/46408/1824826-46408902.pdf?src-supplier=Element14

## Sheet CAN_SHEET.SchDoc
size A4; SheetNumber: 4; SheetTotal: 10
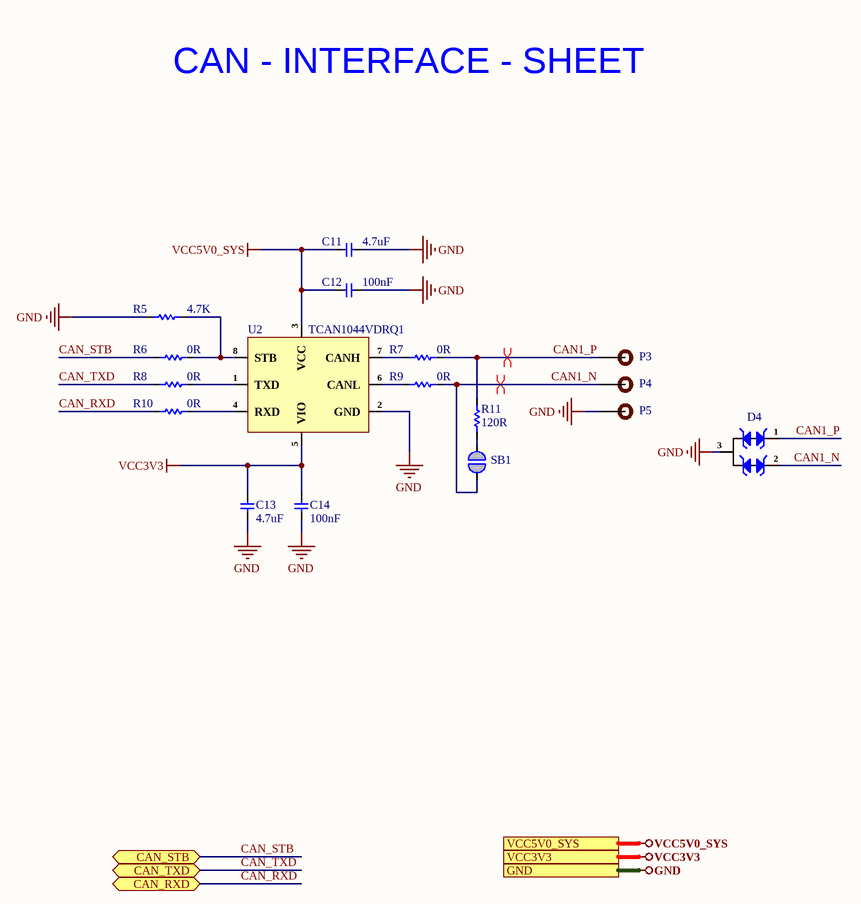
[diagram p3: CAN_SHEET.SchDoc]

### Parts
C11  4.7uF  [Cap-0402]
C12  100nF  [Cap-0402]
C13  4.7uF  [Cap-0402]
C14  100nF  [Cap-0402]
D4  CDSOT23-T24CAN-Q  [SOT-23]  (value not drawn)
P3  0.5mm Test Pad  [0.5mm Test Pad]  (value not drawn)  (no BOM)
P4  0.5mm Test Pad  [0.5mm Test Pad]  (value not drawn)  (no BOM)
P5  0.5mm Test Pad  [0.5mm Test Pad]  (value not drawn)  (no BOM)
R5  4.7K  [Res-0402]
R6  0R  [Res-0402]
R7  0R  [Res-0402]
R8  0R  [Res-0402]
R9  0R  [Res-0402]
R10  0R  [Res-0402]
R11  120R  [Res-0603]
SB1  Solder Bridge 0603  [Solder Bridge]  (value not drawn)  (no BOM)
U2  TCAN1044VDRQ1  [SOIC-8(0.154", 3.90mm Width)]

### Ports
CAN_RXD (bidir, see radxa_CM3J_SHEET-1[4C]), CAN_STB (bidir, see radxa_CM3J_SHEET-1[4C]), CAN_TXD (bidir, see radxa_CM3J_SHEET-1[4C]), GND (see GPS_INTERFACE_SHEET[3D], HDMI2.0_SHEET[3D], JOYSTICK_BUTTON_SHEET[3D], MIPI_DISPLAY-SHEET[3D], MISCELLANEOUS_SHEET[3D], POWER_SHEET[3C], radxa_CM3J_SHEET-1[4C], radxa_CM3J_SHEET-2[3D], TYPE-C_INTERFACE_SHEET[3D]), VCC3V3 (see JOYSTICK_BUTTON_SHEET[3D], radxa_CM3J_SHEET-1[4C]), VCC5V0_SYS (see HDMI2.0_SHEET[3D], MIPI_DISPLAY-SHEET[3D], POWER_SHEET[3C], radxa_CM3J_SHEET-1[4C], TYPE-C_INTERFACE_SHEET[3D])

### Nets
GND: C11.1 C12.1 C13.1 C14.1 D4.3 P5.1 R5.1 U2.2(GND) ; port GND
VCC3V3: C13.2 C14.2 U2.5(VIO) ; port VCC3V3
VCC5V0_SYS: C11.2 C12.2 U2.3(VCC) ; port VCC5V0_SYS
CAN1_N: D4.2 P4.1 R9.2 SB1.1
CAN1_P: D4.1 P3.1 R7.2 R11.2
CAN_RXD: R10.1 ; port CAN_RXD  [project net CAN0_RX_M1]
CAN_STB: R6.1 ; port CAN_STB
CAN_TXD: R8.1 ; port CAN_TXD  [project net CAN0_TX_M1]
NetR5_2: R5.2 R6.2 U2.8(STB)
NetR7_1: R7.1 U2.7(CANH)
NetR8_2: R8.2 U2.1(TXD)
NetR9_1: R9.1 U2.6(CANL)
NetR10_2: R10.2 U2.4(RXD)
NetR11_1: R11.1 SB1.2

### Layout directives
differential pair; differential pair class CAN: CAN1_N, CAN1_P

### Notes on the sheet
- CAN - INTERFACE - SHEET
- File:
- Title:
- Date:
- Page
- Num:
- Total:
- Drawn By: Huzaifa Ali

### Library data of the parts
C11 C13 = CC0402KRX5R6BB475: CAP CER 4.7UF 10V X5R 0402; Manufacturer: Yageo; Tolerance: 10%; Supplier 1: Farnell; Manufacturer Part Number: CC0402KRX5R6BB475; RoHS: Yes; Category: Ceramic Capacitors; Stock 1: 20000; Pricing 1: 10000=0.02310, 50000=0.02100 (GBP); Mount: Surface Mount; Case/Package: 0402; Case Code (Imperial): 0402; Case Code (Metric): 1005; Min Operating Temperature: -55°C; Max Operating Temperature: 85°C; Packaging: Cut Tape; Capacitance: 4.7uF; Voltage Rating: 10V; RoHS Compliant: Yes; ComponentLink1URL: http://www.yageo.com/documents/recent/UPY-GPHC_X5R_4V-to-50V_25.pdf?src-supplier=Digi-Key; ComponentLink1Description: http://www.yageo.com/documents/recent/UPY-GPHC_X5R_4V-to-50V_25.pdf?src-supplier=Digi-Key; Supplier Part Number 1: 3871698; LCSC Part Number: C326586
C12 C14 = CC0402KRX5R7BB104: as C7 on sheet radxa_CM3J_SHEET-1; Supplier 1: Mouser; Manufacturer Part Number: CC0402KRX5R7BB104; RoHS: Yes; Category: Ceramic Capacitors; Stock 1: 936792; Pricing 1: 1=0.10000, 10=0.02300, 50=0.02300, 100=0.01100, 1000=0.00600, 10000=0.00400 (USD); Mount: Surface Mount; Case/Package: 0402; Number of Pins: 2; Case Code (Metric): 1005; Case Code (Imperial): 0402; Min Operating Temperature: -55°C; Max Operating Temperature: 85°C; Capacitance: 100nF; Dielectric: X5R; Packaging: Tape and Reel; Voltage Rating: 16V; Package Quantity: 1; Voltage Rating (DC): 16V; Termination: SMD/SMT; Resistor Type: Ceramic; Series: CC; Construction: Flat; Length: 1mm; Width: 0.02inch; Height: 0.5mm; Thickness: 0.022inch; Depth: 0.5mm; Radiation Hardening: No; REACH SVHC: Unknown; Lead Free: Lead Free; Halogen Free: Halogen Free; RoHS Compliant: Yes; ComponentLink1URL: https://datasheet.ciiva.com/155/mlccorderingcode-155879.pdf?src-supplier=Digi-Key; ComponentLink1Description: https://datasheet.ciiva.com/155/mlccorderingcode-155879.pdf?src-supplier=Digi-Key; ComponentLink2URL: https://datasheet.ciiva.com/155/mlccorderingcode-155878.pdf?src-supplier=Digi-Key; ComponentLink2Description: https://datasheet.ciiva.com/155/mlccorderingcode-155878.pdf?src-supplier=Digi-Key; ComponentLink3URL: https://datasheet.ciiva.com/155/mlccorderingcode-155880.pdf?src-supplier=Digi-Key; ComponentLink3Description: https://datasheet.ciiva.com/155/mlccorderingcode-155880.pdf?src-supplier=Digi-Key; ComponentLink4URL: https://datasheet.ciiva.com/11464/upy-gphc-x5r-4v-to-50v-12-11464869.pdf?src-supplier=Avnet; ComponentLink4Description: https://datasheet.ciiva.com/11464/upy-gphc-x5r-4v-to-50v-12-11464869.pdf?src-supplier=Avnet; Supplier Part Number 1: 603-CC402KRX5R7BB104; LCSC Part Number: C106204
D4 = CDSOT23-T24CAN-Q: TVS DIODE 24VWM 40VC SOT23-3; Manufacturer: Bourns; Item Type: TVS Diodes; Supplier: Digikey; LCSC Part Number: C350941; Manufacturer Part Number: CDSOT23-T24CAN-Q; RoHS: Yes; Stock: 17231; Pricing: 1=0.36, 10=0.282, 100=0.1691, 500=0.15656, 1000=0.10645, 3000=0.098, 6000=0.09393, 9000=0.08454, 30000=0.08328, 75000=0.07827 (USD); RoHS Compliant: 5897YesNo; ComponentLink1URL: http://www.farnell.com/datasheets/2372435.pdf?src-supplier=Farnell; ComponentLink1Description: http://www.farnell.com/datasheets/2372435.pdf?src-supplier=Farnell; ComponentLink2URL: https://www.bourns.com/docs/Product-Datasheets/cdsot23-t24can-Q.pdf?src-supplier=Digikey; ComponentLink2Description: https://www.bourns.com/docs/Product-Datasheets/cdsot23-t24can-Q.pdf?src-supplier=Digikey; ComponentLink3URL: http://www.farnell.com/datasheets/2372435.pdf?src-supplier=Newark; ComponentLink3Description: http://www.farnell.com/datasheets/2372435.pdf?src-supplier=Newark
P3-P5 = 0.5mm Test Pad: Test pad
R5 = RC0402FR-074K7L: as R38 on sheet radxa_CM3J_SHEET-1; Supplier 1: Avnet; Manufacturer Part Number: RC0402FR-074K7L; RoHS: Yes; Category: Chip SMD Resistors; Stock 1: 2420000; Pricing 1: 10000=0.00085 (USD); Case/Package: 0402; Number of Pins: 2; Case Code (Imperial): 0402; Case Code (Metric): 1005; Size Code: 0402; Min Operating Temperature: -55°C; Max Operating Temperature: 155°C; Tolerance: 1%; Voltage Rating: 50V; Packaging: Tape and Reel; Resistor Type: Thick Film; Termination: SMD/SMT; Features: Moisture Resistant; Series: RC; Number of Terminations: 2; Resistance Tolerance: 1%; Construction: Rectangular; Length: 1mm; Width: 0.5mm; Height: 0.32mm; Depth: 0.5mm; Height - Seated (Max): 0.016inch; RoHS Compliant: Yes; Reach SVHC Compliant: Yes; Military Standard: Not; Lead Free: Lead Free; ComponentLink1URL: https://datasheet.ciiva.com/22661/1686128-22661342.pdf?src-supplier=Element14; ComponentLink1Description: https://datasheet.ciiva.com/22661/1686128-22661342.pdf?src-supplier=Element14; ComponentLink2URL: https://datasheet.ciiva.com/7850/1018594-7850022.pdf?src-supplier=Element14; ComponentLink2Description: https://datasheet.ciiva.com/7850/1018594-7850022.pdf?src-supplier=Element14; ComponentLink3URL: https://datasheet.ciiva.com/7850/1018594-7850023.pdf?src-supplier=Element14; ComponentLink3Description: https://datasheet.ciiva.com/7850/1018594-7850023.pdf?src-supplier=Element14; ComponentLink4URL: https://datasheet.ciiva.com/15215/getdatasheetpartid-328119-15215035.pdf?src-supplier=Verical; ComponentLink4Description: https://datasheet.ciiva.com/15215/getdatasheetpartid-328119-15215035.pdf?src-supplier=Verical; Supplier Part Number 1: RC0402FR-074K7L; LCSC Part Number: C105871
R6-R10 = RC0402FR-070RL: RES 0 OHM JUMPER 1/16W 0402; Manufacturer: Yageo; Item Type: Resistors; Tolerance: 1%; Power Rating: 62.5mW; Voltage Rating: 50V; Temperature Coefficient: 200ppm/°C; Max Power Dissipation: 63mW; Supplier 1: Mouser; Manufacturer Part Number: RC0402FR-070RL; RoHS: Yes; Stock 1: 8556842; Pricing 1: 1=0.10000, 10=0.01400, 50=0.01400, 100=0.00600, 1000=0.00300, 5000=0.00200, 10000=0.00100 (USD); Mount: Surface Mount; Case/Package: 0402; Contact Plating: Tin,Matte; Case Code (Imperial): 0402; Case Code (Metric): 1005; Size Code: 0402; Min Operating Temperature: -55°C; Max Operating Temperature: 155°C; Resistance: 0R; Resistor Type: Thick Film; Packaging: Tape and Reel; Termination: SMD/SMT; Features: Moisture Resistant; Series: RC; Number of Terminations: 2; Length: 1mm; Width: 0.5mm; Height: 0.35mm; Radiation Hardening: No; Lead Free: Lead Free; RoHS Compliant: Yes; ComponentLink1URL: https://datasheet.ciiva.com/8896/pyu-rc0402-51-rohs-l-6-8896149.pdf?src-supplier=Avnet; ComponentLink1Description: https://datasheet.ciiva.com/8896/pyu-rc0402-51-rohs-l-6-8896149.pdf?src-supplier=Avnet; ComponentLink2URL: https://datasheet.ciiva.com/16790/pyu-rc0402-51-rohs-l-6-r-16790444.pdf?src-supplier=Future+Electronics; ComponentLink2Description: https://datasheet.ciiva.com/16790/pyu-rc0402-51-rohs-l-6-r-16790444.pdf?src-supplier=Future+Electronics; Supplier Part Number 1: 603-RC0402FR-070RL; LCSC Part Number: C106231
R11 = RC0603FR-07120RL: RES 120 OHM 1% 1/10W 0603; Manufacturer: Yageo; Temperature Coefficient: 100ppm/°C; Voltage Rating (DC): 50V; Power Rating: 100mW; Item Type: Resistor; Supplier 1: Digi-Key; Manufacturer Part Number: RC0603FR-07120RL; RoHS: Yes; Category: Chip SMD Resistors; Stock 1: 839061; Pricing 1: 1=0.10000, 10=0.02400, 100=0.00970, 1000=0.00436, 2500=0.00378 (USD); Case/Package: 0603; Number of Pins: 2; Case Code (Metric): 1608; Case Code (Imperial): 0603; Size Code: 0603; Min Operating Temperature: -55°C; Max Operating Temperature: 155°C; Resistance: 120R; Tolerance: 1%; Resistor Type: Thick Film; Packaging: Tape and Reel; Voltage Rating: 50V; Package Quantity: 1; Number of Terminations: 2; Termination: SMD/SMT; Max Power Dissipation: 100mW; Features: Moisture Resistant; Series: RC; Construction: Rectangular; Resistance Tolerance: 1%; Length: 1.6mm; Width: 0.031inch; Height: 0.022inch; Depth: 0.8mm; REACH SVHC: No SVHC; Lead Free: Lead Free; Military Standard: Not; RoHS Compliant: Yes; ComponentLink1URL: https://datasheet.ciiva.com/2553/pyu-r-int-thick-7-2553512.pdf?src-supplier=Digi-Key; ComponentLink1Description: https://datasheet.ciiva.com/2553/pyu-r-int-thick-7-2553512.pdf?src-supplier=Digi-Key; ComponentLink2URL: https://datasheet.ciiva.com/7746/443971-7746248.pdf?src-supplier=Element14; ComponentLink2Description: https://datasheet.ciiva.com/7746/443971-7746248.pdf?src-supplier=Element14; ComponentLink3URL: https://datasheet.ciiva.com/2553/pyu-r-int-thick-7-2553513.pdf?src-supplier=Digi-Key; ComponentLink3Description: https://datasheet.ciiva.com/2553/pyu-r-int-thick-7-2553513.pdf?src-supplier=Digi-Key; ComponentLink4URL: https://datasheet.ciiva.com/7746/443971-7746249.pdf?src-supplier=Element14; ComponentLink4Description: https://datasheet.ciiva.com/7746/443971-7746249.pdf?src-supplier=Element14; ComponentLink5URL: https://datasheet.ciiva.com/2553/pyu-r-int-thick-7-2553514.pdf?src-supplier=Digi-Key; ComponentLink5Description: https://datasheet.ciiva.com/2553/pyu-r-int-thick-7-2553514.pdf?src-supplier=Digi-Key; ComponentLink6URL: https://datasheet.ciiva.com/46395/443971-46395021.pdf?src-supplier=Element14; ComponentLink6Description: https://datasheet.ciiva.com/46395/443971-46395021.pdf?src-supplier=Element14; Supplier Part Number 1: 311-120HRCT-ND; LCSC Part Number: C114640
SB1 = Solder Bridge 0603: Solder Bridge ON; Manufacturer Part Number: Solder Bridge; Item Type: Solder Bridge
U2 = TCAN1044VDRQ1: IC TRANSCEIVER 1/1 8SOIC; Manufacturer: Texas Instruments; Supplier: Mouser; Supplier Part Number: 595-TCAN1044VDRQ1; Manufacturer Part Number: TCAN1044VDRQ1; RoHS: Yes; Category: Interface ICs; Stock: 317; Pricing: 1=1.4, 10=1.19, 50=1.19, 100=0.912, 1000=0.636, 10000=0.554 (USD); ComponentLink1URL: http://www.ti.com/general/docs/suppproductinfo.tsp?distId=10&amp;gotoUrl=http%3A%2F%2Fwww.ti.com%2Flit%2Fgpn%2Ftcan1044-q1&src-supplier=Digikey; ComponentLink1Description: http://www.ti.com/general/docs/suppproductinfo.tsp?distId=10&amp;gotoUrl=http%3A%2F%2Fwww.ti.com%2Flit%2Fgpn%2Ftcan1044-q1&src-supplier=Digikey; LCSC Part Number: C1852061; Item Type: IC